# Altium schematic sheet POWER.SchDoc
size A4; SheetNumber: 3; SheetTotal: 6
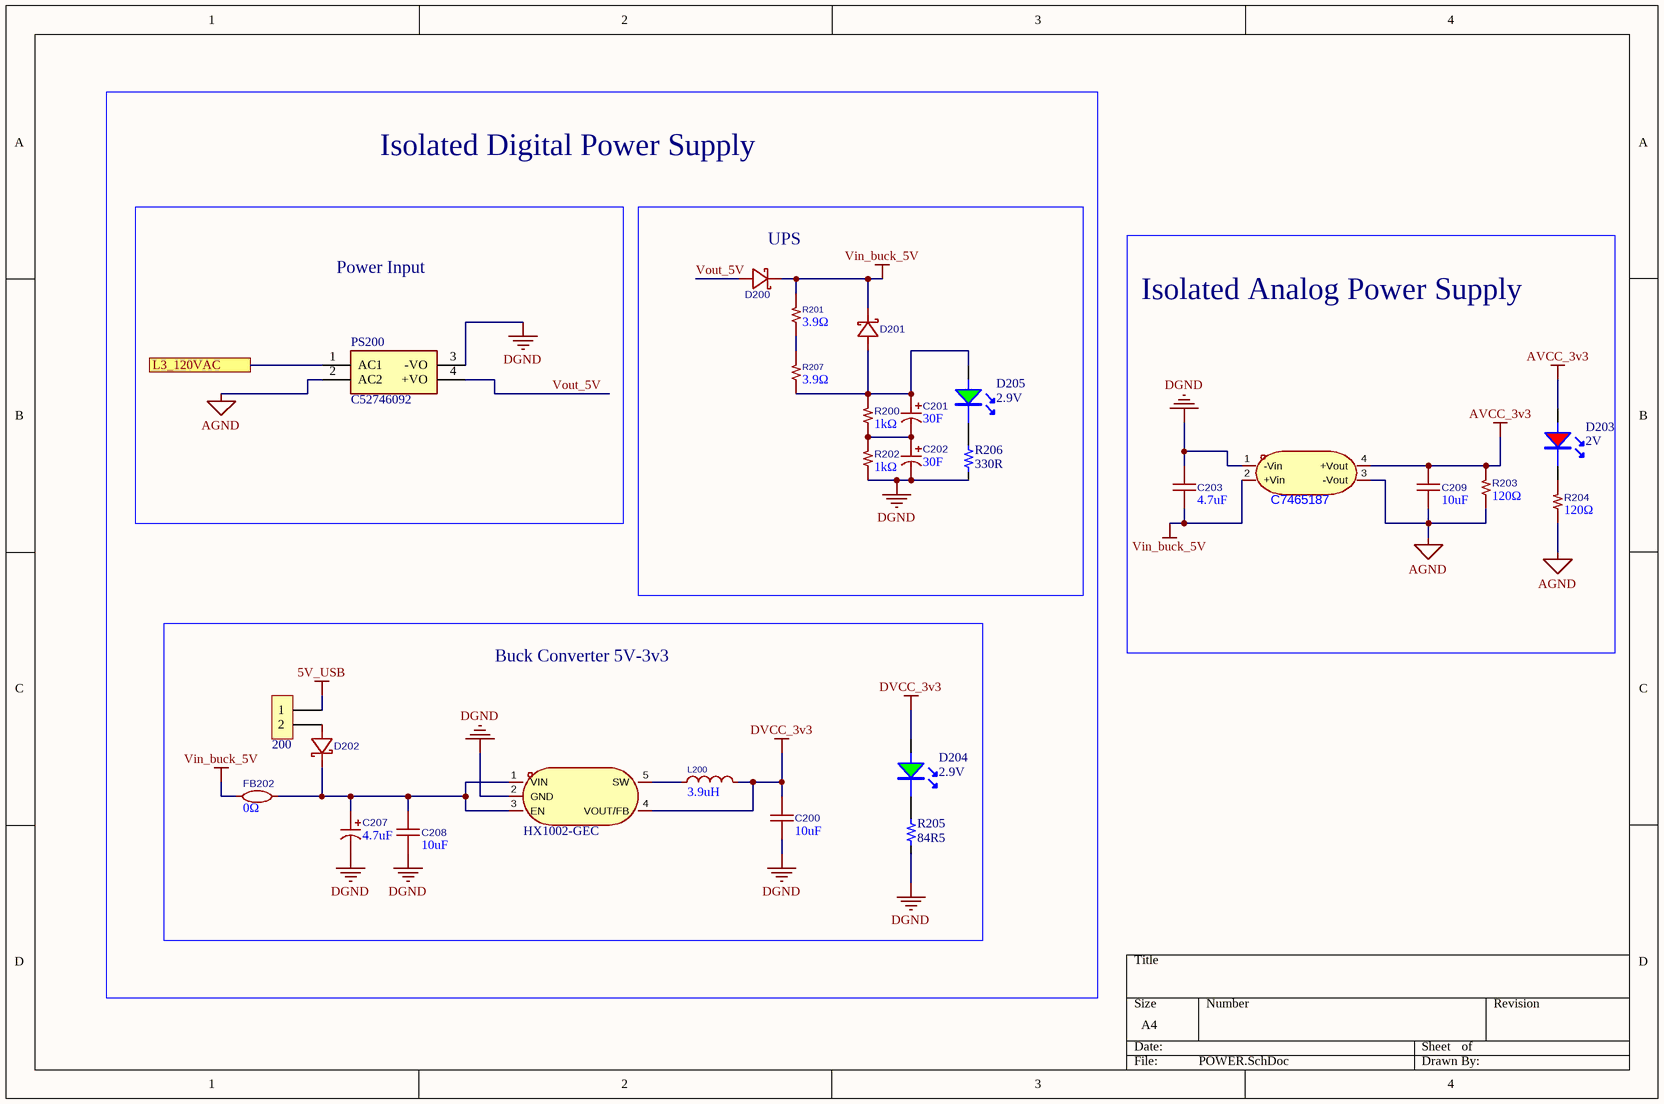
[diagram p0: POWER.SchDoc]

## Parts
200  2x1  [H_2x1_TH_100mil]  (value not drawn)  (no BOM)
C200  value 10uF  [0805_cap]  (hidden comment: muRata GRM21BR61C106KE15L)
C201  value 30F  [CAP-TH_BD18.0-P7.50-D0.8-FD-H26.0]  (hidden comment: hp-2r7-j306vyj23)
C202  value 30F  [CAP-TH_BD18.0-P7.50-D0.8-FD-H26.0]  (hidden comment: hp-2r7-j306vyj23)
C203  value 4.7uF  [0603_cap]  (hidden comment: Samsung Electro-Mechanics)
C207  value 4.7uF  [CAP-SMD_BD4.0-L4.3-W4.3-FD]  (hidden comment: rvt1e4r7m0405)
C208  value 10uF  [0805_cap]  (hidden comment: muRata GRM21BR61C106KE15L)
C209  value 10uF  [0805_cap]  (hidden comment: muRata GRM21BR61C106KE15L)
D200  ms2a40lws  [SMA_L4.4-W2.8-LS5.4-RD]  (value not drawn)
D201  ms2a40lws  [SMA_L4.4-W2.8-LS5.4-RD]  (value not drawn)
D202  ms2a40lws  [SMA_L4.4-W2.8-LS5.4-RD]  (value not drawn)
D203  2V  [0805_LED]
D204  2.9V  [0805_LED]
D205  2.9V  [0805_LED]
FB202  value 0Ω  [0603_cap]  (hidden comment: Yanchuang SCBM160808U090T)
L200  value 3.9uH  [IND-SMD_L4.0-W4.0_VLCF4028T]  (hidden comment: znr4030st3r9m)
PS200  C52746092  [CONV_HLK-10M05]
R200  value 1kΩ  [0603_RES]  (hidden comment: FOJAN FRC0603F1001TS)
R201  value 3.9Ω  [R2512]  (hidden comment: RES 3900mΩ ±5% 2W 2512)
R202  value 1kΩ  [0603_RES]  (hidden comment: FOJAN FRC0603F1001TS)
R203  value 120Ω  [0603_RES]  (hidden comment: HWA CHN HRC0603F1200ENTN)
R204  value 120Ω  [0603_RES]  (hidden comment: RES 120Ω ±1% 100mW 0603)
R205  value 84R5  [0603_RES]  (hidden comment: 84R5 1/10W)
R206  value 330R  [0603_res]  (hidden comment: 330R 1/10W)
R207  value 3.9Ω  [R2512]  (hidden comment: RES 3900mΩ ±5% 2W 2512)
U200  hx1002-gec  [SOT-23-5_L2.9-W1.6-P0.95-LS2.9-BL]
U202  Supplier Part Number 1: C7465187  [PWRM-TH_B0503S-1WR2]  (hidden comment: b0503s-1wr3_c7465187)

## Blocks framed on the sheet
Power Input: PS200
UPS: C201 C202 D200 D201 D205 R200-R202 R206 R207
Isolated Analog Power Supply: C203 C209 D203 R203 R204 U202
Buck Converter 5V-3v3: 200 C200 C207 C208 D202 D204 FB202 L200 R205 U200

## Ports
L3_120VAC (see MAIN[2B], THREE PHASES[1C])

## Nets
5V_USB: 200.1
AGND: C209.1 PS200.2(AC2) R203.1 R204.1 U202.3(-Vout)
AVCC_3v3: C209.2 D203.1(A) R203.2 U202.4(+Vout)
DGND: C200.1 C202.2 C203.2 C207.2 C208.1 PS200.3(-VO) R202.1 R205.1 R206.1 U200.2(GND) U202.1(-Vin)
DVCC_3v3: C200.2 D204.1(A) L200.2 U200.4(VOUT/FB)
Vin_buck_5V: C203.1 D200.1(K) D201.1(K) FB202.2 R201.2 U202.2(+Vin)
L3_120VAC: PS200.1(AC1) ; port L3_120VAC
Vout_5V: D200.2(A) PS200.4(+VO)
Net200_2: 200.2 D202.2(A)
NetC201_1: C201.1 D201.2(A) D205.1(A) R200.2 R207.1
NetC201_2: C201.2 C202.1 R200.1 R202.2
NetC207_1: C207.1 C208.2 D202.1(K) FB202.1 U200.1(VIN) U200.3(EN)
NetD203_2: D203.2 R204.2
NetD204_2: D204.2 R205.2
NetD205_2: D205.2 R206.2
NetL200_1: L200.1 U200.5(SW)
NetR201_1: R201.1 R207.2

## Notes on the sheet
- Isolated Digital Power Supply

## Library data of the parts
200 = H_Male_2x1_TH_100mil: ComponentLink1Description: LCSC
C200 C208 C209 = CAP CER 10uF 16V X5R 0805: ComponentLink1Description: New link; ComponentLink1URL: https://www.lcsc.com/es/product-detail/C77075.html?spm=wm.fly.bg.11.xh___wm.fly.dhl.mly.13-0-3&lcsc_vid=ElBYBFACR1JaVQdSQ1NeBFwHFAdfUFIFEwUNXlwCEVQxVlNfRlVWUFNWT1hWUDtW; Manufacturer 1: muRata; Manufacturer Part Number 1: GRM21BR61C106KE15L; Supplier Part Number 1: C77075; Supplier 1: LCSC
C201 C202 = CAP_ELEC_30F_TH: Capacitance:30F Tolerance:0%~+30% Tolerance:0%~+30% Voltage Rating:2.7V Pin Spacing:7.5mm Diameter:18mm Height - Seated (Max):26mm Operating Temperature:-40℃~+70℃ Operating Temperature:-40℃~+70℃; Manufacturer 1: KAMCAP; ComponentLink1Description: LCSC; ComponentLink1URL: https://www.lcsc.com/product-detail/C7436773.html?s_z=n_q_HP-2R7-J306VYJ23; Supplier 1: LCSC; Manufacturer Part Number 1: HP-2R7-J306VYJ23; Supplier Part Number 1: C7436773
C203 = CAP CER 4.7uF 16V X5R 0603: Manufacturer Part Number 1: CL10A475KO8NNNC; ComponentLink1Description: New link; ComponentLink1URL: https://www.lcsc.com/es/product-detail/C19666.html?spm=wm.fly.bg.0.xh___wm.fly.tp.3.ml&lcsc_vid=T1JZUwUCEwNbBlAHEwBdAVwDRAQPAV1eEVFfVgECQlMxVlNfRFdeV1BRRFhaUzsOAxUeFF5JWBYZEEoKFBINSQcJGk4LFEsFFhULAAsUDk5dV0oOAwwC; Manufacturer 1: Samsung Electro-Mechanics; Supplier Part Number 1: C19666; Supplier 1: LCSC
C207 = CAP_AL_4.7uF_SMD: Capacitance:4.7uF Tolerance:±20% Tolerance:±20% Voltage Rating:25V Diameter:4mm Height - Seated (Max):5.4mm Operating Temperature:-40℃~+105℃ Operating Temperature:-40℃~+105℃; Manufacturer 1: ROQANG; ComponentLink1Description: LCSC; ComponentLink1URL: https://www.lcsc.com/es/product-detail/C41435083.html?s_z=n_q_t_capacitor&spm=wm.fly.bg.1.xh___wm.ssy.tc.4.tz&lcsc_vid=T1EMUlBeR1ALUlVSFANeUFcFR1BWV1EHFVFaA1dQElAxVlNfRlJaV1FUQldbXzsOAxUeFF5JWBYZEEoKFBINSQcJGk4NBhYS; Supplier 1: LCSC; Manufacturer Part Number 1: RVT1E4R7M0405; Supplier Part Number 1: C41435083
D200-D202 = DIOD_SHOT_2A: 30V 1 Independent 125mV@1mA 1.5A SOD-123F Single Diodes RoHS; Manufacturer 1: onsemi; Manufacturer Part Number 1: MBRA210LT3G; ComponentLink1Description: LCSC; ComponentLink1URL: https://www.lcsc.com/product-detail/C145190.html; Supplier 1: LCSC; Supplier Part Number 1: C145190
D203 = LED_0805_RED: LED RED CLEAR 0805 SMD; Manufacturer: XINGLIGHT; Manufacturer Part Number: XL-2012SURC; Supplier 1: LCSC; Supplier Part Number 1: C965812; ComponentLink1Description: LCSC; ComponentLink1URL: https://www.lcsc.com/product-detail/Light-Emitting-Diodes-LED_XINGLIGHT-XL-2012SURC_C965812.html
D204 D205 = LED_0805_Green: LED GREEN CLEAR 0805 SMD; Manufacturer: XINGLIGHT; Manufacturer Part Number: XL-2012UGC; Supplier 1: LCSC; Supplier Part Number 1: C965815; ComponentLink1Description: LCSC; ComponentLink1URL: https://www.lcsc.com/product-detail/Light-Emitting-Diodes-LED_XINGLIGHT-XL-2012UGC_C965815.html
FB202 = FERR_10mohms 15o@100MHz: 10mΩ 15Ω@100MHz 0603 Ferrite Beads and Chips; ComponentLink1Description: LCSC; ComponentLink1URL: https://www.lcsc.com/es/product-detail/C52205324.html?s_z=s_c_Ferrite%2520Beads%2520and%2520Chips&spm=wm.fly.bg.0.xh&lcsc_vid=T1EMUlBeR1ALUlVSFANeUFcFR1BWV1EHFVFaA1dQElAxVlNfRlJaVFNSQlhYUjsOAxUeFF5JWBYZEEoKFBINSQcJGk4LFEsFFhULAAsUDk5fVlNWWQkaCgg%3D; Supplier 1: LCSC; Supplier Part Number 1: C52205324; Manufacturer 1: Yanchuang; Manufacturer Part Number 1: SCBM160808U090T
L200 = IND 3.9uH 2.3A 57mohms: Inductance:3.9uH Tolerance:±20% Tolerance:±20% Current Rating:2.3A Current - Saturation(Isat):3.3A DC Resistance(DCR):57mΩ Type:Magnetic Shielded Inductor; Manufacturer 1: ZE; ComponentLink1Description: LCSC; ComponentLink1URL: https://www.lcsc.com/product-detail/C42429307.html?s_z=n_q_ZNR4030ST3R9M; Supplier 1: LCSC; Manufacturer Part Number 1: ZNR4030ST3R9M; Supplier Part Number 1: C42429307
PS200 = HLK-10M05: 10W Ultra-Compact Power Module; Manufacturer 1: HI-LINK; Manufacturer Part Number 1: HLK-10M05T; Value: HI_LINK_5V; ComponentLink1Description: LCSC; ComponentLink1URL: https://www.lcsc.com/es/product-detail/C52746092.html?s_z=n_q_HLK-10M05&spm=wm.fly.bg.1.xh&lcsc_vid=FFRdVwAETgNbVwAHTlRdV1UFEwcIU1ZXQVZZAlYFQAcxVlNfRlJdUlVUT1RdXzsOAxUeFF5JWBYZEEoKFBINSQcJGk4LFEsWBQ4KEgcSWgULEwUPG04tVVxVQFFXVUoOAwwC; Supplier 1: LCSC; Supplier Part Number 1: C52746092
R200 R202 = RES 1kohms ±1% 100mW 0603: RES 1kΩ ±1% 100mW 0603; ComponentLink1Description: New link; ComponentLink1URL: https://www.lcsc.com/es/product-detail/C2907002.html?spm=wm.fly.bg.1.xh___wm.fly.dhl.mly.13-6-1&lcsc_vid=T1EMUlBeR1ALUlVSFANeUFcFR1BWV1EHFVFaA1dQElAxVlNfRlJaV1FUQldbXzsOAxUeFF5JWBYZEEoKFBINSQcJGk4NBhYS; Supplier 1: LCSC; Supplier Part Number 1: C2907002; Manufacturer Part Number 1: FRC0603F1001TS; Manufacturer 1: FOJAN
R201 R207 = RES 3900mohms ±5% 2W 2512: Type:Thick Film Resistor Resistance:3.9Ω Tolerance:±5% Tolerance:±5% Power(Watts):2W Voltage-Supply(Max):300V Operating Temperature:-55℃~+155℃ Operating Temperature:-55℃~+155℃; Manufacturer 1: UNI-ROYAL; Manufacturer Part Number 1: HP122WJ039JT4E; Supplier Part Number 1: C2758800; Supplier 1: LCSC; ComponentLink1Description: New link; ComponentLink1URL: https://www.lcsc.com/product-detail/C2758800.html?s_z=n_q_RES%25203900m%25CE%25A9%2520%25C2%25B15%2525%25202W%25202512&spm=wm.fly.bg.0.xh&lcsc_vid=FgNcU1VVElNeBldeQQRZX1dUEQNWVQcHT1lYV11XRlMxVlNfQ1ZbX1xVRlddXjsOAxUeFF5JWBYZEEoKFBINSQcJGk4dAgUUFAk%3D
R203 = RES_120ohms 50V: 100mW 120 50V Thick Film Resistor ±1% ±100ppm/℃ 0603 Chip Resistor - Surface Mount; Manufacturer 1: HWA CHN; Manufacturer Part Number 1: HRC0603F1200ENTNV; ComponentLink1Description: New link; ComponentLink1URL: https://www.lcsc.com/es/product-detail/C54920849.html?spm=wm.fly.bg.0.xh___wm.fly.dhl.mly.13-6-1&lcsc_vid=T1EMUlBeR1ALUlVSFANeUFcFR1BWV1EHFVFaA1dQElAxVlNfRlJaV1FUQldbXzsOAxUeFF5JWBYZEEoKFBINSQcJGk4NBhYS; Supplier Part Number 1: C54920849; Supplier 1: LCSC
R204 = RES 120ohms 100mW150V Thick Film Resistor  ±100ppm 0805: Manufacturer 1: HWA CHN; Manufacturer Part Number 1: HRC0805F1200FNTN; ComponentLink1Description: New link; ComponentLink1URL: https://www.lcsc.com/product-detail/C48996813.html; Supplier Part Number 1: C54921099; Supplier 1: LCSC
R205 = Res_84R5_0603_1/10W: 100mW Thick Film Resistor 50V ±100ppm/℃ ±1% 84.5Ω 0603 Chip Resistor - Surface Mount ROHS; Manufacturer: LIZ Elec; Manufacturer Part Number: CR0603FA84R5G; ComponentLink1URL: https://lcsc.com/product-detail/Chip-Resistor-Surface-Mount_LIZ-Elec-CR0603FA84R5G_C101216.html; Supplier 1: LCSC; Supplier Part Number 1: C101216; ComponentLink1Description: LCSC
R206 = Res_330R_0603_1/10W: RES SMD 330R OHM 5% 1/10W 0603; Manufacturer: FOJAN; Manufacturer Part Number: FRC0603J331 TS; ComponentLink1URL: https://www.lcsc.com/product-detail/Chip-Resistor-Surface-Mount_FOJAN-FRC0603J331-TS_C2907152.html; Supplier 1: LCSC; Supplier Part Number 1: C2907152; ComponentLink1Description: LCSC
U200 = hx1002-gec: Function:Step-down type Voltage - Supply:3.4V~5.5V Voltage - Supply:3.4V~5.5V Output Voltage:3.3V Output Voltage:3.3V Output Current:1.3A Frequency - Switching:1MHz Frequency - Switching:1MHz Operating Temperature:-40℃~+85℃@(TA) Operating Temperature:-40℃; Manufacturer 1: HEXIN; Manufacturer Part Number 1: HX1002-GEC; Supplier 1: LCSC; Supplier Part Number 1: C47115461; ComponentLink1Description: New link; ComponentLink1URL: https://www.lcsc.com/product-detail/C47115461.html?s_z=n_q_HX1002-GEC&spm=wm.fly.bg.0.xh&lcsc_vid=FgNcU1VVElNeBldeQQRZX1dUEQNWVQcHT1lYV11XRlMxVlNfQ1ZbXlRTRVZbVjsOAxUeFF5JWBYZEEoKFBINSQcJGk4eFQsCAgIaSgADAwAHC0slRVZbX1xWR08GEwkK
U202 = b0503s-1wr3_c7465187: Type:Plastic encapsulated type Number of Outputs:1 Output Power:1W Voltage - Supply:4.5V~5.5V Voltage - Supply:4.5V~5.5V Conversion Efficiency:74% Conversion Efficiency:74% Output Voltage:3.3V Output Voltage:3.3V Output Current(Max):303mA Output Current(M; Manufacturer 1: EVISUN(易成); Manufacturer Part Number 1: B0503S-1WR3; Supplier 1: LCSC; ComponentLink1Description: LCSC; ComponentLink1URL: https://www.lcsc.com/product-detail/C7465187.html?s_z=n_q_p_b0503s-1wr3_c7465187